# Altium project PCB_Project.PrjPcb (part 5 of 8)
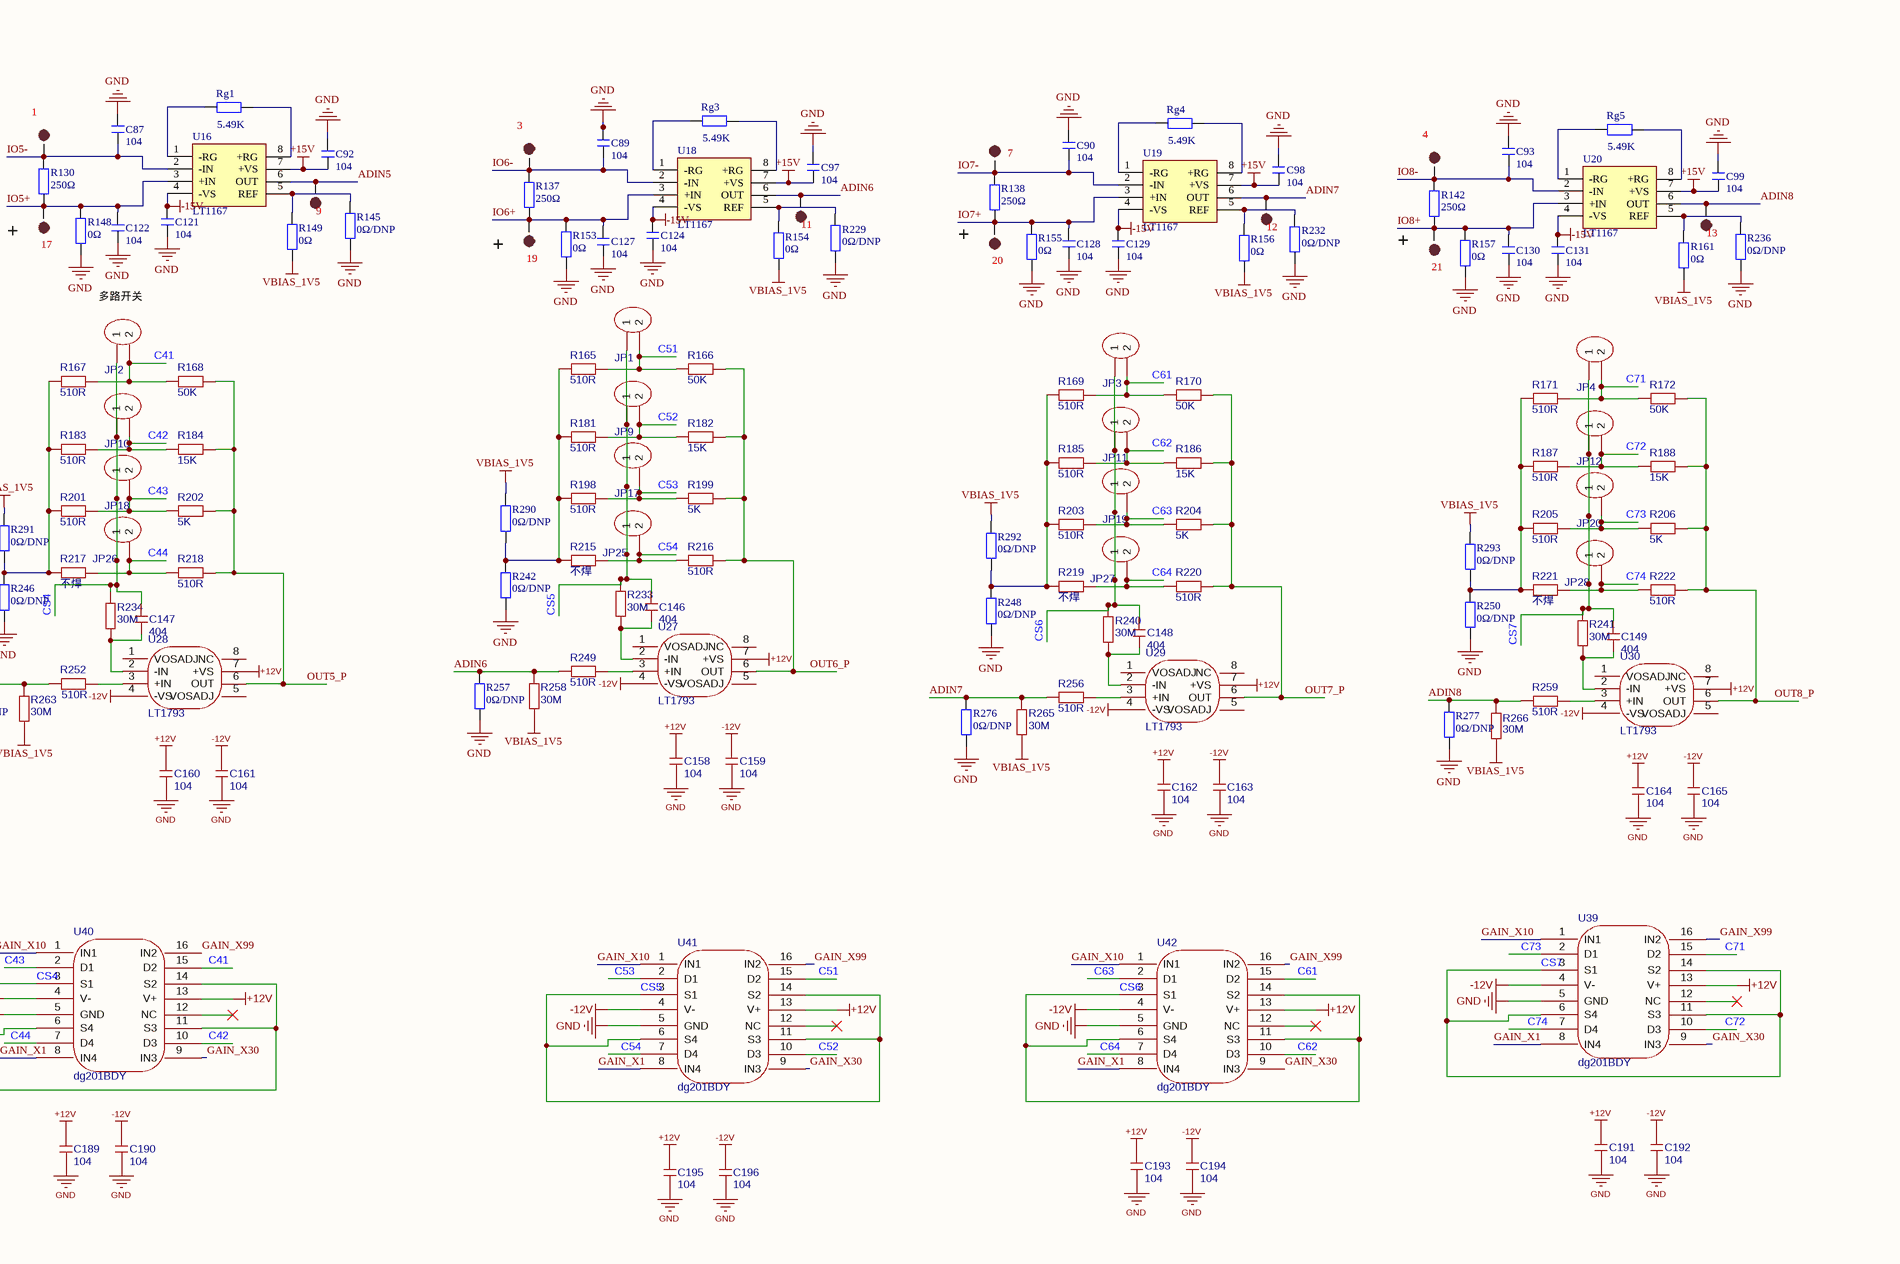
[diagram p7: DSP大板子.SchDoc, bottom right]

## Sheet DSP大板子.SchDoc (continued)